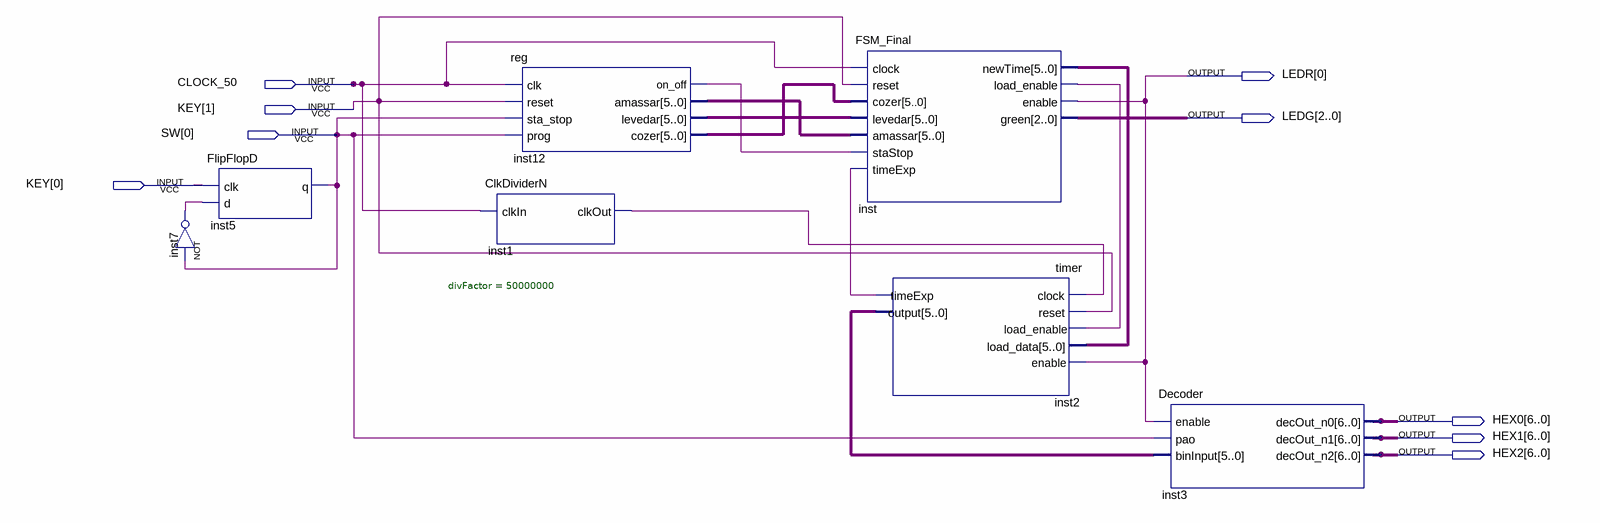
[diagram p0: schematic sheet]
// Quartus schematic Projeto_Final.bdf as structural Verilog: 7 symbols, 9 pins
module Projeto_Final (
  input  CLOCK_50,
  input  [1:0] KEY,
  input  [0:0] SW,
  output [0:0] LEDR,
  output [2:0] LEDG,
  output [6:0] HEX0,
  output [6:0] HEX1,
  output [6:0] HEX2
);

  wire inst1_clkout, inst2_timeexp, inst7_out, inst12_on_off, inst_load_enable;
  wire [5:0] inst2_output, inst12_amassar, inst12_cozer, inst12_levedar, inst_newtime;

  not inst7 (inst7_out, SW[0]);
  FlipFlopD inst5 (.clk(KEY[0]), .d(inst7_out), .q(SW[0]));
  \reg  inst12 (
    .clk(CLOCK_50), .reset(KEY[1]), .sta_stop(SW[0]), .prog(SW[0]), .on_off(inst12_on_off),
    .amassar(inst12_amassar), .levedar(inst12_levedar), .cozer(inst12_cozer));
  ClkDividerN #(.divFactor(50000000)) inst1 (.clkIn(CLOCK_50), .clkOut(inst1_clkout));
  FSM_Final inst (
    .clock(CLOCK_50), .reset(KEY[1]), .cozer(inst12_cozer), .levedar(inst12_levedar),
    .amassar(inst12_amassar), .staStop(inst12_on_off), .timeExp(inst2_timeexp), .newTime(inst_newtime),
    .load_enable(inst_load_enable), .enable(LEDR[0]), .green(LEDG));
  timer inst2 (
    .clock(inst1_clkout), .reset(KEY[1]), .load_enable(inst_load_enable), .load_data(inst_newtime),
    .enable(LEDR[0]), .timeExp(inst2_timeexp), .\output (inst2_output));
  Decoder inst3 (
    .enable(LEDR[0]), .pao(SW[0]), .binInput(inst2_output), .decOut_n0(HEX0), .decOut_n1(HEX1),
    .decOut_n2(HEX2));
endmodule
